# EAGLE design pocket_sdr_v2.1 (EAGLE 9.6.2)
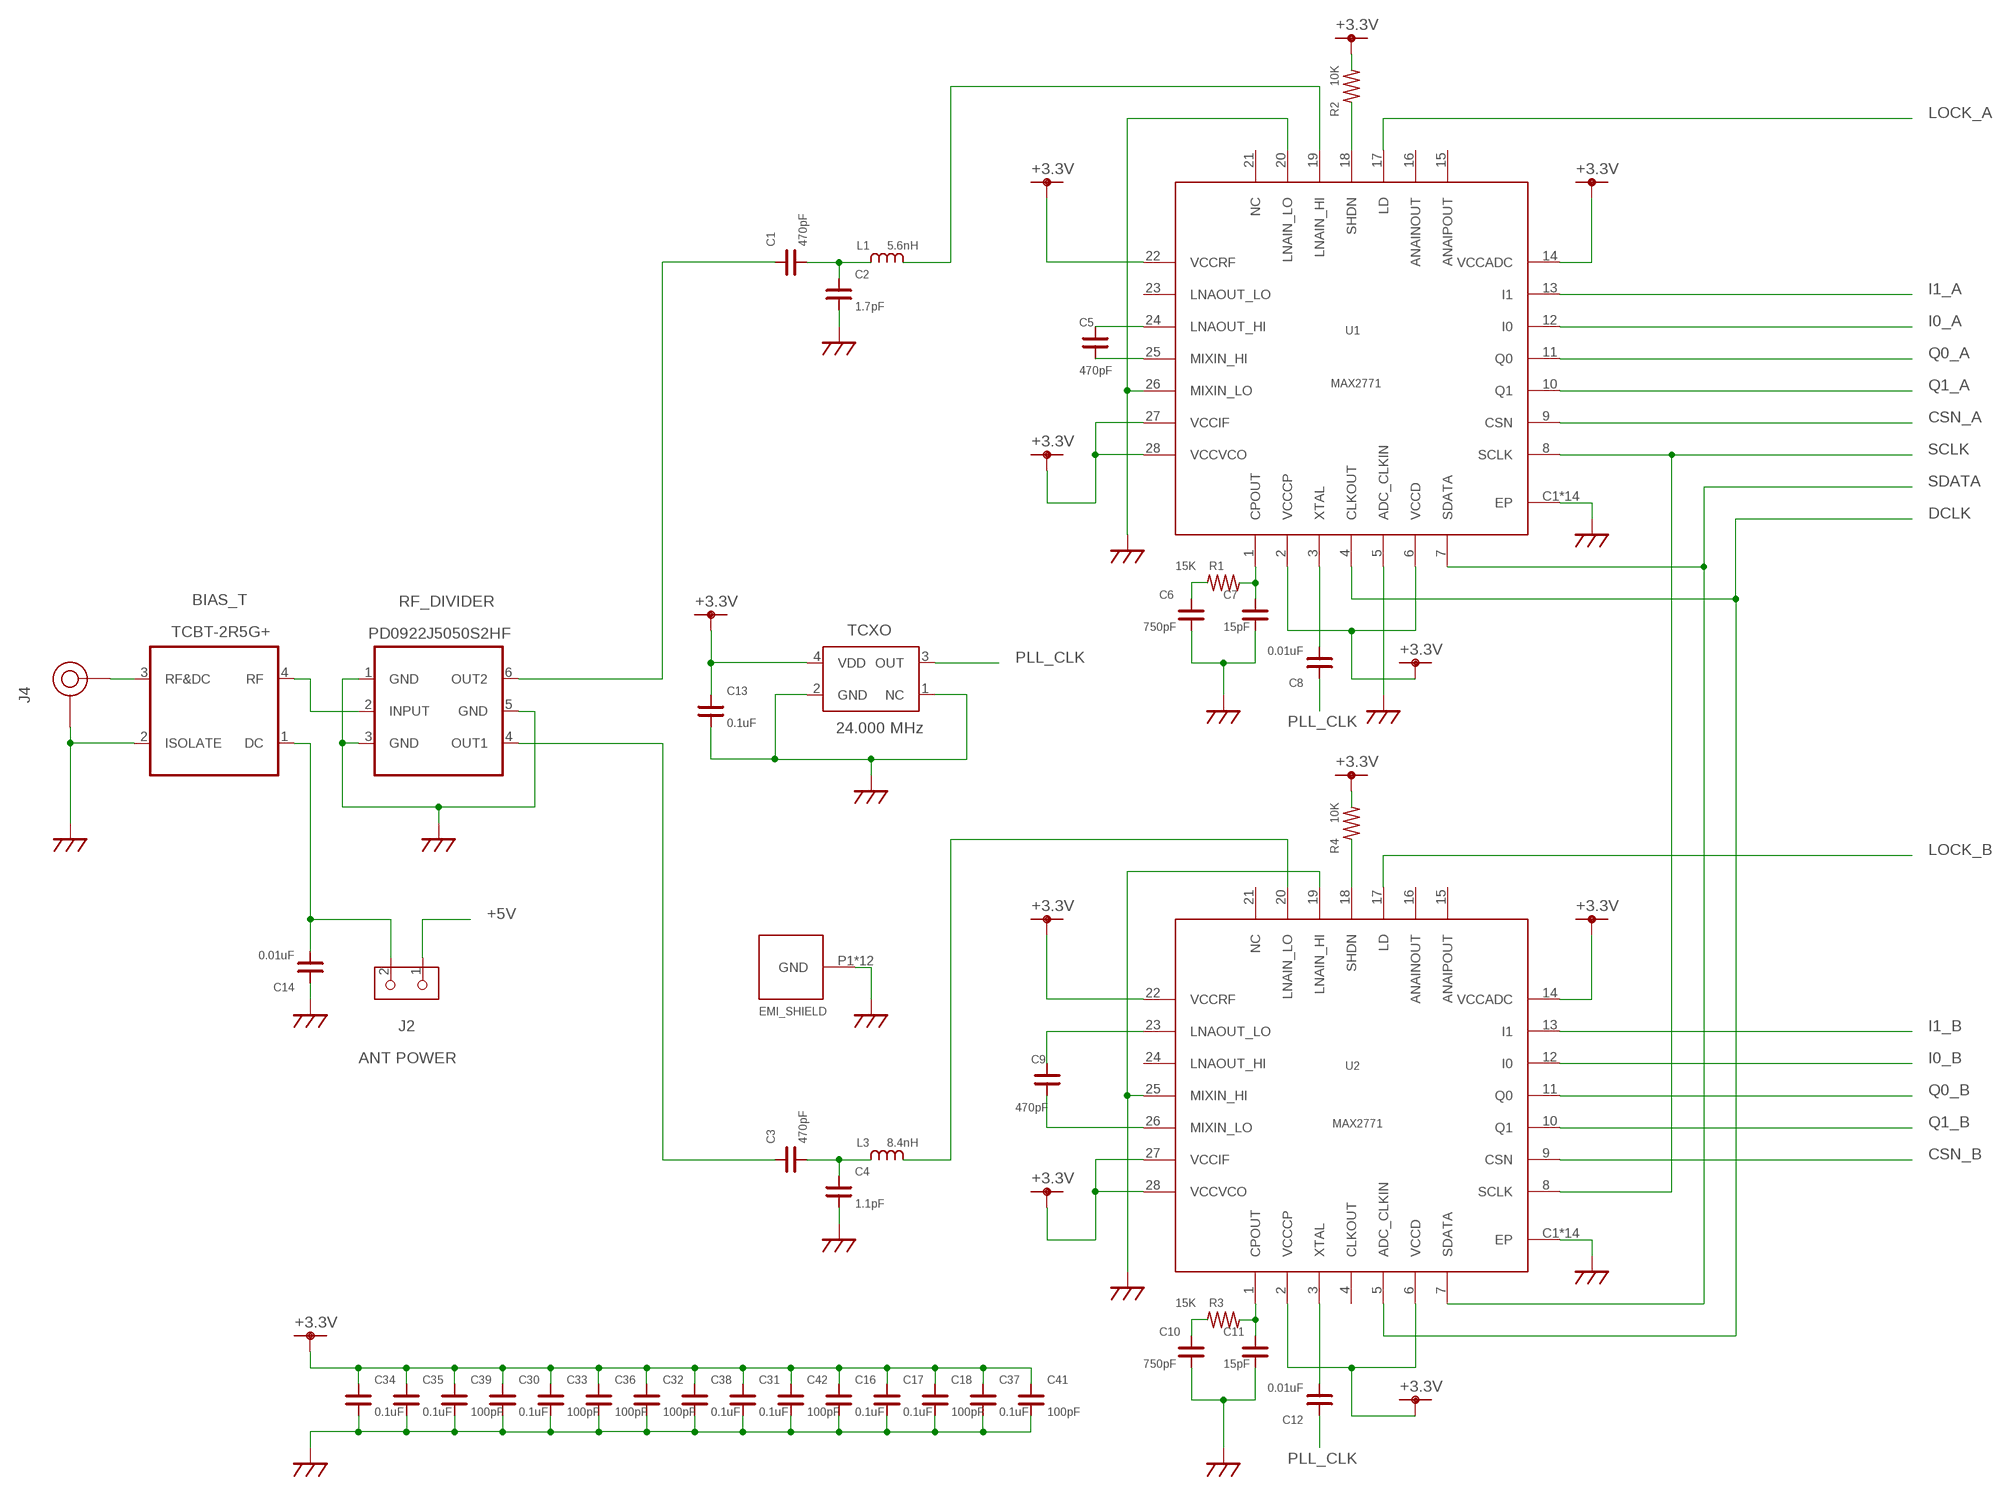
[diagram p0: schematic, sheet 1, part 1 of 2]
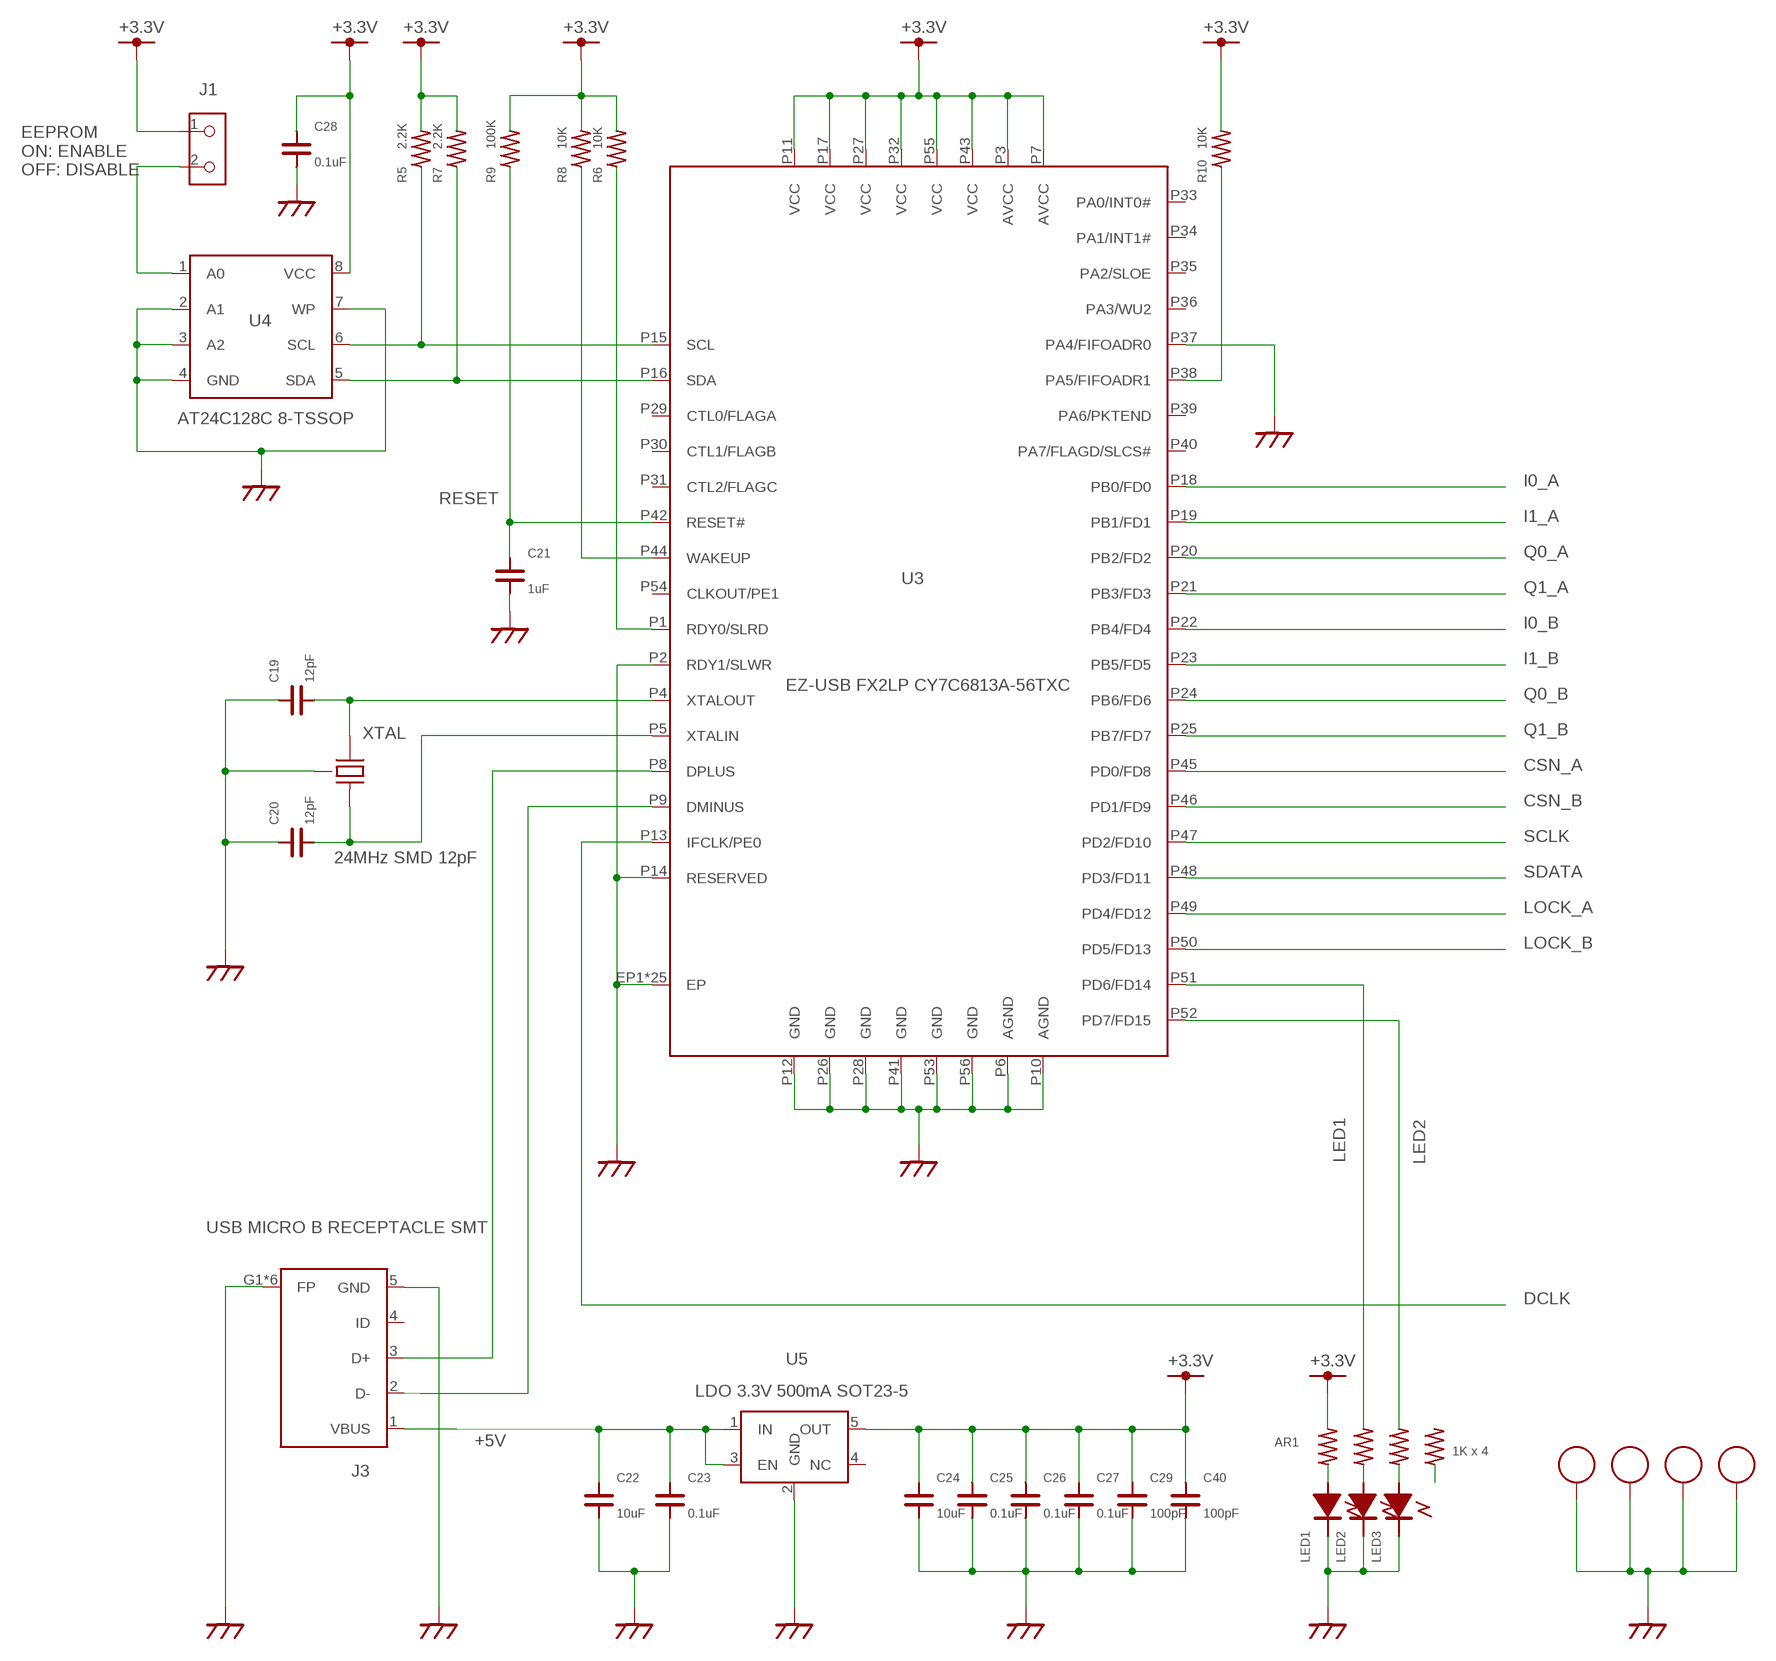
[diagram p1: schematic, sheet 1, part 2 of 2]

## Parts
AR1  1K x 4  ARRAY_REG__EXB28V  [EXB28V]
BIAS_T  TCBT-2R5G+  BIAS_T  [BIAS_T]
C1  470pF  C1005  [C1005]
C2  1.7pF  C1005  [C1005]
C3  470pF  C1005  [C1005]
C4  1.1pF  C1005  [C1005]
C5  470pF  C1005  [C1005]
C6  750pF  C1005  [C1005]
C7  15pF  C1005  [C1005]
C8  0.01uF  C1005  [C1005]
C9  470pF  C1005  [C1005]
C10  750pF  C1005  [C1005]
C11  15pF  C1005  [C1005]
C12  0.01uF  C1005  [C1005]
C13  0.1uF  C1005  [C1005]
C14  0.01uF  C1005  [C1005]
C16  0.1uF  C1005  [C1005]
C17  0.1uF  C1005  [C1005]
C18  100pF  C1005  [C1005]
C19  12pF  C1005  [C1005]
C20  12pF  C1005  [C1005]
C21  1uF  C1005  [C1005]
C22  10uF  C3225  [C3225]
C23  0.1uF  C1005  [C1005]
C24  10uF  C3225  [C3225]
C25  0.1uF  C1005  [C1005]
C26  0.1uF  C1005  [C1005]
C27  0.1uF  C1005  [C1005]
C28  0.1uF  C1005  [C1005]
C29  100pF  C1005  [C1005]
C30  0.1uF  C1005  [C1005]
C31  0.1uF  C1005  [C1005]
C32  100pF  C1005  [C1005]
C33  100pF  C1005  [C1005]
C34  0.1uF  C1005  [C1005]
C35  0.1uF  C1005  [C1005]
C36  100pF  C1005  [C1005]
C37  0.1uF  C1005  [C1005]
C38  0.1uF  C1005  [C1005]
C39  100pF  C1005  [C1005]
C40  100pF  C1005  [C1005]
C41  100pF  C1005  [C1005]
C42  100pF  C1005  [C1005]
J1  PIN HEADER 2MM 2P  PINH_2MM_2P  [PINH-2MM-2P]
J2  PIN HEADER 2MM 2P  PINH_2MM_2P  [PINH-2MM-2P]
J3  USB MICRO B RECEPTACLE SMT  MICROUSB  [MICROUSB]
J4  SMA JACK EDGE MNT  SMA-ANG  [SMA-ANG]
L1  5.6nH  L1608  [C1608]
L3  8.4nH  L1608  [C1608]
LED1  LED1608 GREEN  LED1608  [LED_1608]
LED2  LED1608 BLUE  LED1608  [LED_1608]
LED3  LED1608 BLUE  LED1608  [LED_1608]
R1  15K  R1005  [C1005]
R2  10K  R1005  [C1005]
R3  15K  R1005  [C1005]
R4  10K  R1005  [C1005]
R5  2.2K  R1005  [C1005]
R6  10K  R1005  [C1005]
R7  2.2K  R1005  [C1005]
R8  10K  R1005  [C1005]
R9  100K  R1005  [C1005]
R10  10K  R1005  [C1005]
RF-SHEILD-CASE  BMI-S-202-F BMI-S-202-C  BMI-S-202  [BMI-S-202]
RF_DIVIDER  PD0922J5050S2HF  RF_DIV  [RF_DIV]
TCXO  24.000 MHz  TCXO  [TCXO]
U1  MAX2771  [TQFN28]
U2  MAX2771  [TQFN28]
U3  EZ-USB FX2LP CY7C6813A-56TXC  CY7C6813A  [QFN56]
U4  AT24C128C 8-TSSOP  AT24C256C  [TSSOP_8P]
U5  LDO 3.3V 500mA SOT23-5  LDO_SOT  [SOT23]
U$53  CPAD_2.2MM  [CPAD_2.2MM]
U$54  CPAD_2.2MM  [CPAD_2.2MM]
U$55  CPAD_2.2MM  [CPAD_2.2MM]
U$58  CPAD_2.2MM  [CPAD_2.2MM]
XTAL  24MHz SMD 12pF  XTAL_SMD  [XTAL_SMD]

## Nets
+3.3V: AR1.2 C13.1 C16.1 C17.1 C18.1 C24.P$1 C25.1 C26.1 C27.1 C28.1 C29.1 C30.1 C31.1 C32.1 C33.1 C34.1 C35.1 C36.1 C37.1 C38.1 C39.1 C40.1 C41.1 C42.1 J1.1 R2.2 R4.2 R5.2 R6.2 R7.2 R8.2 R9.2 R10.2 TCXO.4(VDD) U1.2(VCCCP) U1.6(VCCD) U1.14(VCCADC) U1.22(VCCRF) U1.27(VCCIF) U1.28(VCCVCO) U2.2(VCCCP) U2.6(VCCD) U2.14(VCCADC) U2.22(VCCRF) U2.27(VCCIF) U2.28(VCCVCO) U3.P3(AVCC) U3.P7(AVCC) U3.P11(VCC) U3.P17(VCC) U3.P27(VCC) U3.P32(VCC) U3.P43(VCC) U3.P55(VCC) U4.8(VCC) U5.5(OUT)
+5V: C22.P$1 C23.1 J2.1 J3.1(VBUS) U5.1(IN) U5.3(EN)
CSN_A: U1.9(CSN) U3.P45(PD0/FD8)
CSN_B: U2.9(CSN) U3.P46(PD1/FD9)
DCLK: U1.4(CLKOUT) U2.5(ADC_CLKIN) U3.P13(IFCLK/PE0)
FIFOADR1: R10.1 U3.P38(PA5/FIFOADR1)
GND: BIAS_T.2(ISOLATE) C2.1 C4.2 C6.2 C7.2 C10.2 C11.2 C13.2 C14.1 C16.2 C17.2 C18.2 C19.1 C20.1 C21.2 C22.P$2 C23.2 C24.P$2 C25.2 C26.2 C27.2 C28.2 C29.2 C30.2 C31.2 C32.2 C33.2 C34.2 C35.2 C36.2 C37.2 C38.2 C39.2 C40.2 C41.2 C42.2 J3.5(GND) J3.G1(FP) J3.G2(FP) J3.G3(FP) J3.G4(FP) J3.G5(FP) J3.G6(FP) J4.P2(GND) J4.P3(GND) J4.P4(GND) J4.P5(GND) LED1.2 LED2.2 LED3.2 RF-SHEILD-CASE.P1(GND) RF-SHEILD-CASE.P2(GND) RF-SHEILD-CASE.P3(GND) RF-SHEILD-CASE.P4(GND) RF-SHEILD-CASE.P5(GND) RF-SHEILD-CASE.P6(GND) RF-SHEILD-CASE.P7(GND) RF-SHEILD-CASE.P8(GND) RF-SHEILD-CASE.P9(GND) RF-SHEILD-CASE.P10(GND) RF-SHEILD-CASE.P11(GND) RF-SHEILD-CASE.P12(GND) RF_DIVIDER.1(GND) RF_DIVIDER.3(GND) RF_DIVIDER.5(GND) TCXO.1(NC) TCXO.2(GND) U1.5(ADC_CLKIN) U1.20(LNAIN_LO) U1.26(MIXIN_LO) U1.C1(EP) U1.C2(EP) U1.C3(EP) U1.C4(EP) U1.EP U1.V1(EP) U1.V2(EP) U1.V3(EP) U1.V4(EP) U1.V5(EP) U1.V6(EP) U1.V7(EP) U1.V8(EP) U1.V9(EP) U2.19(LNAIN_HI) U2.25(MIXIN_HI) U2.C1(EP) U2.C2(EP) U2.C3(EP) U2.C4(EP) U2.EP U2.V1(EP) U2.V2(EP) U2.V3(EP) U2.V4(EP) U2.V5(EP) U2.V6(EP) U2.V7(EP) U2.V8(EP) U2.V9(EP) U3.EP1(EP) U3.EP2(EP) U3.EP3(EP) U3.EP4(EP) U3.EP5(EP) U3.P2(RDY1/SLWR) U3.P6(AGND) U3.P10(AGND) U3.P12(GND) U3.P14(RESERVED) U3.P26(GND) U3.P28(GND) U3.P37(PA4/FIFOADR0) U3.P41(GND) U3.P53(GND) U3.P56(GND) U3.P$1(EP) U3.P$2(EP) U3.P$3(EP) U3.P$4(EP) U3.P$5(EP) U3.P$6(EP) U3.P$7(EP) U3.P$8(EP) U3.P$9(EP) U3.P$10(EP) U3.P$11(EP) U3.P$12(EP) U3.P$13(EP) U3.P$14(EP) U3.P$15(EP) U3.P$16(EP) U3.P$17(EP) U3.P$18(EP) U3.P$19(EP) U3.P$20(EP) U4.2(A1) U4.3(A2) U4.4(GND) U4.7(WP) U5.2(GND) U$53.EP U$54.EP U$55.EP U$58.EP XTAL.P2(GND) XTAL.P4(GND)
I0_A: U1.12(I0) U3.P18(PB0/FD0)
I0_B: U2.12(I0) U3.P22(PB4/FD4)
I1_A: U1.13(I1) U3.P19(PB1/FD1)
I1_B: U2.13(I1) U3.P23(PB5/FD5)
LED1: AR1.4 U3.P51(PD6/FD14)
LED2: AR1.6 U3.P52(PD7/FD15)
LOCK_A: U1.17(LD) U3.P49(PD4/FD12)
LOCK_B: U2.17(LD) U3.P50(PD5/FD13)
N$1: C5.2 U1.25(MIXIN_HI)
N$2: C5.1 U1.24(LNAOUT_HI)
N$3: BIAS_T.3(RF&DC) J4.P1(RF)
N$4: BIAS_T.4(RF) RF_DIVIDER.2(INPUT)
N$5: BIAS_T.1(DC) C14.2 J2.2
N$6: R6.1 U3.P1(RDY0/SLRD)
N$8: AR1.3 LED2.1(+)
N$9: C1.2 C2.2 L1.1
N$10: C8.2 U1.3(XTAL)
N$11: AR1.7
N$12: L1.2 U1.19(LNAIN_HI)
N$13: AR1.1 LED1.1(+)
N$14: C1.1 RF_DIVIDER.6(OUT2)
N$15: C9.2 U2.26(MIXIN_LO)
N$16: C9.1 U2.23(LNAOUT_LO)
N$17: C19.2 U3.P4(XTALOUT) XTAL.P1(XTAL1)
N$18: R2.1 U1.18(SHDN)
N$20: J3.3(D+) U3.P8(DPLUS)
N$22: C20.2 U3.P5(XTALIN) XTAL.P3(XTAL2)
N$23: AR1.5 LED3.1(+)
N$24: C7.1 R1.2 U1.1(CPOUT)
N$25: C6.1 R1.1
N$27: C11.1 R3.2 U2.1(CPOUT)
N$28: R7.1 U3.P16(SDA) U4.5(SDA)
N$29: R5.1 U3.P15(SCL) U4.6(SCL)
N$30: R8.1 U3.P44(WAKEUP)
N$32: C10.1 R3.1
N$33: J3.2(D-) U3.P9(DMINUS)
N$34: J1.2 U4.1(A0)
N$35: C3.1 RF_DIVIDER.4(OUT1)
N$37: C3.2 C4.1 L3.1
N$38: L3.2 U2.20(LNAIN_LO)
N$42: R4.1 U2.18(SHDN)
N$43: C12.2 U2.3(XTAL)
PLL_CLK: C8.1 C12.1 TCXO.3(OUT)
Q0_A: U1.11(Q0) U3.P20(PB2/FD2)
Q0_B: U2.11(Q0) U3.P24(PB6/FD6)
Q1_A: U1.10(Q1) U3.P21(PB3/FD3)
Q1_B: U2.10(Q1) U3.P25(PB7/FD7)
RESET: C21.1 R9.1 U3.P42(RESET#)
SCLK: U1.8(SCLK) U2.8(SCLK) U3.P47(PD2/FD10)
SDATA: U1.7(SDATA) U2.7(SDATA) U3.P48(PD3/FD11)
Unconnected: AR1.8 J3.4(ID) U1.15(ANAIPOUT) U1.16(ANAINOUT) U1.21(NC) U1.23(LNAOUT_LO) U2.4(CLKOUT) U2.15(ANAIPOUT) U2.16(ANAINOUT) U2.21(NC) U2.24(LNAOUT_HI) U3.P29(CTL0/FLAGA) U3.P30(CTL1/FLAGB) U3.P31(CTL2/FLAGC) U3.P33(PA0/INT0#) U3.P34(PA1/INT1#) U3.P35(PA2/SLOE) U3.P36(PA3/WU2) U3.P39(PA6/PKTEND) U3.P40(PA7/FLAGD/SLCS#) U3.P54(CLKOUT/PE1) U5.4(NC)

## Notes on the sheet
- EEPROM
  ON: ENABLE
  OFF: DISABLE
- ANT POWER

## Library data of the parts
AR1 = ttaka_desc:ARRAY_REG__EXB28V
BIAS_T = ttaka_misc:BIAS_T
C1-C14 C16-C21 C23 C25-C42 = ttaka_desc:C1005
C22 C24 = ttaka_desc:C3225
J1 J2 = ttaka_conn:PINH_2MM_2P
J3 = ttaka_conn:MICROUSB
J4 = ttaka_conn:SMA-ANG
L1 L3 = ublox:L1608
LED1-LED3 = ttaka_desc:LED1608
R1-R10 = ttaka_desc:R1005
RF-SHEILD-CASE = ttaka_misc:BMI-S-202
RF_DIVIDER = ttaka_misc:RF_DIV
TCXO = ttaka_misc:TCXO
U1 U2 = ttaka_ic:MAX2771
U3 = ttaka_ic:CY7C6813A
U4 = ttaka_ic:AT24C256C
U5 = ttaka_misc:LDO_SOT
U$53-U$55 U$58 = ttaka_misc:CPAD_2.2MM
XTAL = ttaka_misc:XTAL_SMD

## Board
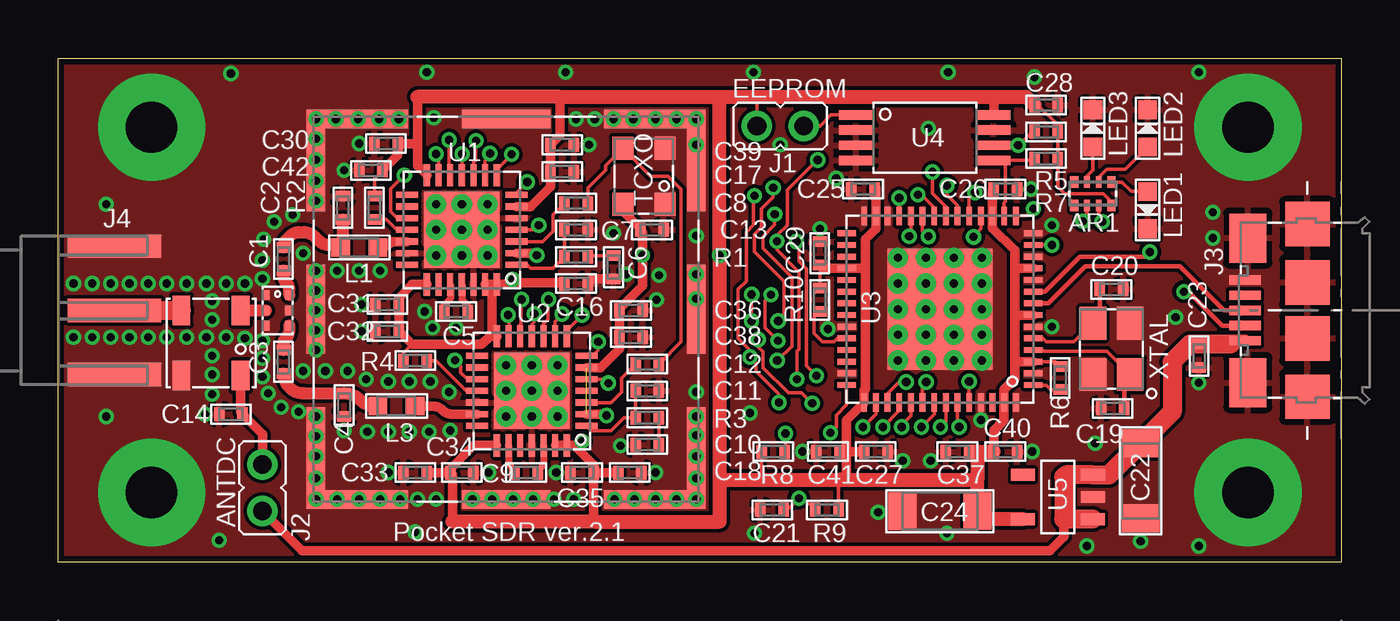
[diagram p2: board, top side]
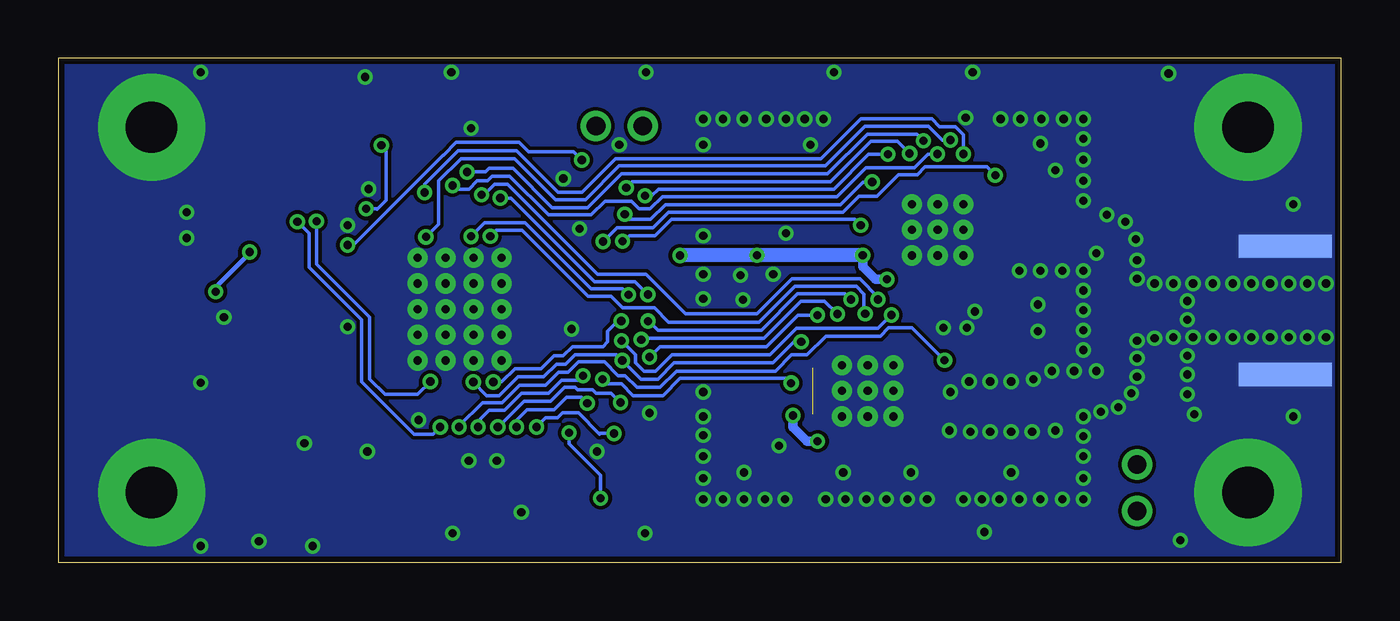
[diagram p3: board, bottom side, seen from below]

Size 55 x 21.6 mm. Coordinates in mm from the lower left corner, seen from the top.
Outline: 0,0 0,21.6 55,21.6 55,0 0,0
Copper layers (1*16): Top 0.035mm / dielectric 1.5mm / Bottom 0.035mm
Design rules "SeeedStudio_2layer_DRU_no_angle_20140221": minimum track width 6mil, minimum drill 12mil, track to track 6mil, track to pad 6mil, pad to pad 6mil, via to via 6mil, smd to smd 0mil, copper to edge 10mil, drill to drill 10mil, minimum pad ring 10mil, minimum via ring 6mil, stop-mask expansion 2mil, vias tented up to drill 100mil, thermal gap 10mil

### Footprints (pad centres in the part's own frame; a part is rotated, then mirrored left to right if it is on the bottom)
EXB28V = smd 0.35 x 0.5: 1 -0.8,-0.5; 2 -0.8,0.5; 7 0.8,-0.5; 8 0.8,0.5 | smd 0.25 x 0.5: 3 -0.25,-0.5; 4 -0.25,0.5; 5 0.25,-0.5; 6 0.25,0.5
BIAS_T = smd 0.762 x 1.27: 1 -1.27,1.397; 2 1.27,1.397; 3 1.27,-1.397; 4 -1.27,-1.397
C1005 = smd 0.45 x 0.6: 1 -0.5,0; 2 0.5,0
C3225 = smd 1.6 x 1.2: P$1 0,1.6; P$2 0,-1.6
PINH-2MM-2P = drill 0.8: 1 0,-1; 2 0,1
MICROUSB = smd 0.4 x 1.35: 1 -1.3,4.125; 2 -0.65,4.125; 3 0,4.125; 4 0.65,4.125; 5 1.3,4.125 | smd 1.9 x 1.9: G1 -3.7,1.45; G2 3.7,1.45; G5 -1.2,1.45; G6 1.2,1.45 | smd 2.1 x 1.6: G3 -3.1,4; G4 3.1,4
SMA-ANG = smd 1 x 4: P1 0,-4; P2 -2.75,-4; P3 2.75,-4 | smd 1 x 4 bottom: P4 -2.75,-4; P5 2.75,-4
C1608 = smd 0.8 x 0.8: 1 -0.8,0; 2 0.8,0
LED_1608 = smd 0.8 x 0.8: 1 -0.8,0; 2 0.8,0
BMI-S-202 = smd 4.35 x 0.8: P1 -6.375,-8.15; P3 6.375,-8.15; P7 6.375,8.15; P9 -6.375,8.15 | smd 3.8 x 0.8: P2 0,-8.15; P8 0,8.15 | smd 0.8 x 4.36: P4 8.15,-6.375; P6 8.15,6.375; P10 -8.15,6.375; P12 -8.15,-6.375 | smd 0.8 x 3.8: P5 8.15,0; P11 -8.15,0
RF_DIV = smd 0.41 x 0.33: 1 0.66,0.5; 2 0,0.5; 3 -0.66,0.5; 4 -0.66,-0.5; 5 0,-0.5; 6 0.66,-0.5
TCXO = smd 1 x 0.9: 1 -1.2,-0.9; 2 1.2,-0.9; 3 1.2,0.9; 4 -1.2,0.9
TQFN28 = smd 0.26 x 0.95: 1 -1.5,-2.34; 2 -1,-2.34; 3 -0.5,-2.34; 4 0,-2.34; 5 0.5,-2.34; 6 1,-2.34; 7 1.5,-2.34; 15 1.5,2.34; 16 1,2.34; 17 0.5,2.34; 18 0,2.34; 19 -0.5,2.34; 20 -1,2.34; 21 -1.5,2.34 | smd 0.95 x 0.26: 8 2.34,-1.5; 9 2.34,-1; 10 2.34,-0.5; 11 2.34,0; 12 2.34,0.5; 13 2.34,1; 14 2.34,1.5; 22 -2.34,1.5; 23 -2.34,1; 24 -2.34,0.5; 25 -2.34,0; 26 -2.34,-0.5; 27 -2.34,-1; 28 -2.34,-1.5 | smd 1.4 x 1.4: C1 -0.85,-0.85; C2 0.85,-0.85; C3 -0.85,0.85; C4 0.85,0.85 | smd 3.25 x 3.25: EP 0,0 | drill 0.35: V1 -1.1,-1.1; V2 0,-1.1; V3 1.1,-1.1; V4 -1.1,0; V5 0,0; V6 1.1,0; V7 -1.1,1.1; V8 0,1.1; V9 1.1,1.1
QFN56 = smd 5.2 x 4.5: EP1 0,0 | smd 2.4 x 2.05: EP2 -1.35,1.175; EP3 1.35,1.175; EP4 -1.35,-1.175; EP5 1.35,-1.175 | smd 0.25 x 0.8: P1 -3.25,-4; P2 -2.75,-4; P3 -2.25,-4; P4 -1.75,-4; P5 -1.25,-4; P6 -0.75,-4; P7 -0.25,-4; P8 0.25,-4; P9 0.75,-4; P10 1.25,-4; P11 1.75,-4; P12 2.25,-4; P13 2.75,-4; P14 3.25,-4; P29 3.25,4; P30 2.75,4; P31 2.25,4; P32 1.75,4; P33 1.25,4; P34 0.75,4; P35 0.25,4; P36 -0.25,4; P37 -0.75,4; P38 -1.25,4; P39 -1.75,4; P40 -2.25,4; P41 -2.75,4; P42 -3.25,4 | smd 0.8 x 0.25: P15 4,-3.25; P16 4,-2.75; P17 4,-2.25; P18 4,-1.75; P19 4,-1.25; P20 4,-0.75; P21 4,-0.25; P22 4,0.25; P23 4,0.75; P24 4,1.25; P25 4,1.75; P26 4,2.25; P27 4,2.75; P28 4,3.25; P43 -4,3.25; P44 -4,2.75; P45 -4,2.25; P46 -4,1.75; P47 -4,1.25; P48 -4,0.75; P49 -4,0.25; P50 -4,-0.25; P51 -4,-0.75; P52 -4,-1.25; P53 -4,-1.75; P54 -4,-2.25; P55 -4,-2.75; P56 -4,-3.25 | drill 0.35 pad 0.7: P$1 -1.1,1.8; P$2 1.1,1.8; P$3 0,1.8; P$4 -2.2,1.8; P$5 2.2,1.8; P$6 -2.2,0.6; P$7 -1.1,0.6; P$8 0,0.6; P$9 1.1,0.6; P$10 2.2,0.6; P$11 -2.2,-0.6; P$12 -1.1,-0.6; P$13 0,-0.6; P$14 1.1,-0.6; P$15 2.2,-0.6; P$16 -2.2,-1.8; P$17 -1.1,-1.8; P$18 0,-1.8; P$19 1.1,-1.8; P$20 2.2,-1.8
TSSOP_8P = smd 0.4 x 1.45: 1 -0.975,-2.95; 2 -0.325,-2.95; 3 0.325,-2.95; 4 0.975,-2.95; 5 0.975,2.95; 6 0.325,2.95; 7 -0.325,2.95; 8 -0.975,2.95
SOT23 = smd 0.508 x 1.016: 1 -0.95,-1.5; 2 0,-1.5; 3 0.95,-1.5; 4 0.95,1.5; 5 -0.95,1.5
CPAD_2.2MM = drill 2.2 pad 4.6: EP 0,0
XTAL_SMD = smd 1.4 x 1.15: P1 -1.1,-0.8; P2 1.1,-0.8; P3 1.1,0.8; P4 -1.1,0.8

### Placement (x,y rotation side)
AR1  44.35,15.8 180 top
BIAS_T  6.55,9.4 180 top
C1  9.65,13 90 top
C2  12.2,15.2 270 top
C3  9.65,8.6 270 top
C4  12.25,6.75 270 top
C5  17.05,10.75 0 top
C6  23.8,12.65 270 top
C7  22.2,14.25 0 top
C8  22.2,15.4 180 top
C9  20.05,3.85 0 top
C10  25.25,5.05 180 top
C11  25.25,7.35 0 top
C12  25.25,8.5 180 top
C13  25.45,14.25 0 top
C14  7.4,6.35 0 top
C16  22.2,11.95 0 top
C17  21.6,16.75 0 top
C18  24.5,3.85 0 top
C19  45.2,6.6 0 top
C20  45.15,11.7 180 top
C21  30.6,2.25 180 top
C22  46.4,3.5 0 top
C23  48.9,8.85 270 top
C24  37.8,2.2 270 top
C25  34.5,16 180 top
C26  40.6,16 0 top
C27  35.05,4.75 0 top
C28  42.35,19.6 0 top
C29  32.65,13.25 90 top
C30  14.05,17.95 180 top
C31  14.1,11.05 180 top
C32  14.1,9.9 180 top
C33  15.3,3.85 180 top
C34  17.3,3.85 0 top
C35  22.45,3.85 180 top
C36  24.55,10.8 0 top
C37  38.55,4.75 180 top
C38  24.55,9.65 0 top
C39  21.6,17.9 0 top
C40  40.6,4.75 0 top
C41  33,4.75 180 top
C42  13.4,16.8 180 top
J1  30.95,18.7 270 top
J2  8.75,3.2 0 top
J3  55,10.8 90 top
J4  -1.6,10.8 90 top
L1  12.9,13.5 0 top
L3  14.5,6.7 0 top
LED1  46.7,15.1 270 top
LED2  46.7,18.6 90 top
LED3  44.35,18.6 90 top
R1  22.2,13.1 180 top
R2  13.55,15.2 90 top
R3  25.25,6.2 180 top
R4  15.3,8.65 180 top
R5  42.35,18.45 0 top
R6  42.95,7.9 90 top
R7  42.35,17.3 0 top
R8  30.65,4.75 180 top
R9  32.95,2.25 0 top
R10  32.65,11.25 90 top
RF-SHEILD-CASE  19.2,10.85 0 top
RF_DIVIDER  9.4,10.8 90 top
TCXO  25.1,16.55 90 top
U1  17.3,14.25 90 top
U2  20.3,7.35 90 top
U3  37.8,10.85 90 top
U4  37.15,18.2 270 top
U5  42.85,2.8 90 top
U$53  4,18.65 0 top
U$54  4,3 0 top
U$55  51,18.65 0 top
U$58  51,3 0 top
XTAL  45.15,9.15 90 top

### Tracks (layer width: path | path; a pad name or v marks a point on that pad's centre or on a via)
+3.3V  (via drill 0.35)  (1 unrouted)
  Top 0.152: 14.55,17.8 C30.1 | J1.1 29.95,19.95 | C42.1 13.55,16.45 R2.2 | R4.2 14.8,8.98 15.16,9.34 | R7.2 R5.2 42.85,18.75 42,19.6 C28.1 | R7.2 42.95,17.2 | R8.2 30.15,3.55 | U3.P3 42.75,8.6 R6.2 | R7.2 42.85,16.1 43.15,15.8 44.8,15.8 45.15,15.45 AR1.2 | R9.2 33.45,3.45 33.55,3.55 | R10.2 32.65,12.45 32.8,12.6
  Top 0.305: U2.22 | U2.27 21.32,5.01
  Top 0.406: 34.6,12.6 34.6,13.85 35.05,14.3 U3.P27 35.05,16.06 C25.1 | 41,10.6 41,8.6 41.05,8.6 | U3.P11 41,12.6 | 41,12.6 41,13.37 40.05,14.32 U3.P17 40.05,15.95 C26.1 | U1.22 15.16,11.91 14.6,11.35 C31.1 C32.1 15.16,9.34 18.15,9.34 18.5,9.69 U2.14 18.6,9.69 18.6,11.61 U1.27 U1.28 19.26,11.91 v19.47,12.13 19.62,11.98 21.67,11.98 C16.1 | v23.5,6.29 23.44,6.35 U2.2 | U1.2 20.42,13.25 v20.51,13.16 | 34.6,12.6 U3.P32 32.8,12.6 C29.1 | 34.6,12.6 34.6,7.43 34.55,7.38 U3.P43 33.8,6.1 33.8,4.8 | U3.P7 41,10.6 | 41,12.6 41,10.6 | 41.05,8.6 U3.P3 | 41.05,8.6 41,8.55 41,7.85 40.55,7.4 U3.P55 40.55,6.1 40.1,5.65 C40.1 C37.1 | 21.5,19.95 21.5,18.3 C39.1 C17.1 21.1,16.1 20.25,15.25 U1.6 | TCXO.4 24.2,15.05 24.95,14.3 C13.1 25.05,14.15 v25.05,13.16 25.05,11.86 24.05,10.86 C36.1 C38.1 24.05,9.15 23.25,8.35 U2.6 | 15.4,19.95 15.4,17.95 | 15.4,17.95 15.4,16.99 U1.14 | 15.4,17.95 C30.1 | C35.1 22.95,4.19 22.2,4.94 v22.45,5.19 22.27,5.01 U2.28 21.32,5.01 | C34.1 16.9,3.75 16.9,1.74 | C34.1 C33.1 | C34.1 16.8,4 17.81,5.01 U2.22 | U4.8 40.1,19.9 40.15,19.95 | C42.1 14.55,17.45 14.55,17.8 | U4.8 40.12,19.2 | 33.55,3.55 33.8,3.8 33.8,4.75 | 33.8,4.8 33.8,4.75 | C41.1 33.55,4.8 33.8,4.8 | 33.8,4.75 C27.1 | U4.8 40.58,19.18 | C35.1 C18.1 | 22.98,1.76 23,1.74 | C35.1 22.95,1.74
  Top 0.61: 22.95,1.74 16.9,1.74 | 23,1.74 28.35,1.74 28.35,3.55 | 28.35,19.95 v28.35,13.15 28.35,3.55 | 15.4,19.95 21.5,19.95 28.35,19.95 | 28.35,19.95 29.95,19.95 40.15,19.95 41.5,19.95 C28.1 | U5.5 39.75,1.85 C24.P$1 39.4,3.55 | 28.35,3.55 30.15,3.55 33.55,3.55 39.4,3.55 | C40.1 39.4,4.75 39.4,3.55
  Bottom 0.406: v20.51,13.16 20.51,12.66 19.98,12.13 v19.47,12.13 | v22.45,5.19 22.9,5.19 23.5,5.79 v23.5,6.29
  Bottom 0.61: v20.51,13.16 v25.05,13.16 28.34,13.16 v28.35,13.15
+5V
  Top 0.406: J2.1 10.45,0.5 42.5,0.5 43.1,1.1 43.1,1.85
  Top 0.508: J3.1 50.4,9.5 50.25,9.35
  Top 0.813: 50.25,9.35 C23.1 48.51,9.35 47.75,8.59 47.75,6.45 C22.P$1 45.05,3.75 U5.3 43.2,3.75 43.1,3.65 43.1,1.85 U5.1
CSN_A  (via drill 0.35)
  Top 0.152: v36.35,7.73 36.05,7.73 35.55,7.23 U3.P45 | v18.5,17.52 18.5,17.42 18.3,17.22 U1.9 | v30.65,16.06 30.65,15.66 30.15,15.16 30.15,14.36 29.85,14.06 29.85,13.3 31.11,12.04 31.11,10.59 v30.86,10.34
  Bottom 0.152: v36.35,7.73 35.99,7.73 35.42,8.3 34.3,8.3 33.75,8.85 33.35,8.85 32.95,9.25 31.65,9.25 31.45,9.45 31.45,9.9 31.01,10.34 v30.86,10.34 | v18.5,17.52 19.03,18.04 20.16,18.04 21.89,16.31 30.4,16.31 v30.65,16.06
CSN_B  (via drill 0.35)
  Top 0.152: U3.P46 36.05,6.5 v35.35,5.8 | U2.9 21.3,10.29 21.31,10.29 21.31,10.31 21.6,10.6 v21.6,10.64 | v30.01,9.54 30.01,9.24 30.22,9.03 30.22,8.35 31.3,7.27 31.87,7.27 v32.32,6.82
  Bottom 0.152: v21.6,10.64 22.15,11.2 23.16,11.2 24.76,9.6 29.96,9.6 v30.01,9.54 | v35.35,5.8 35.35,6.1 34.9,6.55 33.74,6.55 33.22,7.07 32.57,7.07 v32.32,6.82
DCLK  (via drill 0.35)
  Top 0.152: v23.58,7.68 23.41,7.85 U2.5 | U1.4 20.4,14.25 v20.6,14.45 | v31.67,7.84 31.67,9.04 31.76,9.14 31.76,12.44 30.81,13.39 v30.81,13.76 30.81,14.01 31.25,14.45 31.25,14.67 31.27,14.69 31.27,15.97 v32.55,17.25 | U3.P13 42.35,13.6 v42.6,13.6
  Bottom 0.152: v30.81,13.76 30.76,13.76 30.51,14.01 29.41,14.01 28.71,14.7 20.85,14.7 v20.6,14.45 | v23.58,7.68 23.78,7.88 28.35,7.88 29.08,7.15 30.35,7.15 30.85,7.65 31.47,7.65 v31.67,7.84 | v32.55,17.25 32.9,17.6 34.85,17.6 35.25,18 37.94,18 38.49,17.45 38.5,17.45 42.35,13.6 v42.6,13.6
FIFOADR1
  Top 0.152: U3.P38 33.4,9.6 33.24,9.44 32.77,9.44 32.4,9.81 32.4,10.5 R10.1
GND  (via drill 0.35)
  Top 0.406: C16.2 22.9,12.15 C6.2
  other vias: 3.05,9.65 3.85,9.65 2.25,11.95 3.05,11.95 3.85,11.95 4.65,11.95 2.25,9.65 4.65,9.65 49.5,13.9 16.75,7.3 12.9,12.5 11.95,12.5 13.8,12.5 8.75,9.5 8.75,7.95 9,7.25 9.55,6.65 10.5,8.2 10.5,13.25 11.45,8.2 16.8,5.65 13.2,7.85 14.15,7.75 15.05,7.75 15.95,7.75 37.3,18.6 8.75,12.95 8.8,13.85 9.25,14.6 16.1,19.05 27.35,19 27.35,2.7 23.8,19 24.65,19 26.5,19 25.6,19 14.6,19 13.75,19 12.85,19 11.9,19 11.05,19 11.05,18.15 11.05,17.25 11.05,16.35 11.05,15.5 11.05,12.5 11.05,11.65 11.05,10.8 11.05,9.95 11.05,6.25 11.05,5.4 11.05,4.55 11.05,3.6 11.05,2.7 11.95,2.7 12.9,2.7 13.8,2.7 14.65,2.7 17.75,2.7 18.6,2.7 19.5,2.7 20.35,2.7 23.85,2.7 24.7,2.7 25.6,2.7 26.5,2.7 27.35,3.6 27.35,4.55 27.35,5.45 27.35,6.25 10.3,6.45 10.05,14.9 48.9,7.7 6.35,11.95 7.2,11.95 6.35,9.65 8,9.6 8,11.95 2.05,15.35 2.05,6.25 21.75,21 29.8,21 38.15,21 48.9,0.7 48.9,21 6.9,0.95 7.4,20.95 14.15,5.6 13.25,5.6 15.05,5.6 15.9,5.6 12.4,8.2 11.05,9.1 18.45,3.85 15.8,21 1.45,11.95 1.45,9.65 49.5,15 27.35,17.9 27.35,14 27.35,12.35 27.35,11.3 22.2,19 25.65,11.25 16.2,2.7 15.7,10.75 14.15,3.85 47.9,10.5 44.45,5.1 33,10 42.6,14.45 42.6,10.1 30.95,17.9 5.5,11.95 8.75,12.15 7.2,9.65 36.2,4.35 29.65,6.4 24.1,5 31.9,4.75 23.8,14.1 22.1,2.7 41.7,16 0.65,11.95 0.65,9.65 15.3,1.3 29.85,1.25 38.1,1.25 44.1,0.7 6.6,7.2 12.9,17.95 12.25,16.8 13,11.05 13,9.9 21.35,3.85 25.6,3.85 24.35,12.35 22.75,17.9 37.4,4.35 41.75,4.75 33.35,16.45 32.65,14.3 35.15,2.15 46.4,0.9 41.85,20.8 8.75,8.75 27.35,7.3 15.4,2.7 21.25,2.7 23,19 39.55,6.1 5.5,9.65 12.25,5.65 6.3,6.35 6.6,8.85 6.6,8.05 25.75,12.3 6.6,10.4 6.6,11.2 17.05,10.05 16.05,10.05
  pour Top: -14,31 -14,-12 65,-12 65,31
  pour Bottom: -15,32 -15,-13 66,-13 66,32
I0_A  (via drill 0.35)
  Top 0.152: v16.76,18.1 16.76,17.08 16.8,17.04 U1.12 | U3.P18 39.55,14.3 39.24,13.99 v39.24,13.95
  Bottom 0.152: v16.76,18.1 17.1,18.1 17.7,18.7 20.41,18.7 22.12,16.99 30.96,16.99 32.4,15.55 33.69,15.55 35.44,17.3 37.74,17.3 38.69,16.35 38.69,14.5 v39.24,13.95
I0_B  (via drill 0.35)
  Top 0.152: v36.86,15.76 37.01,15.76 37.55,15.21 U3.P22 | U2.12 19.8,10.18 19.84,10.22 19.84,11.25 v19.86,11.27
  Bottom 0.152: v36.86,15.76 36.74,15.76 36.3,16.2 35.73,16.2 31.88,12.35 29.8,12.35 28.1,10.65 25.05,10.65 23.55,12.15 20.64,12.15 19.86,11.37 v19.86,11.27
I1_A  (via drill 0.35)
  Top 0.152: v39.3,15.85 39.05,15.6 U3.P19 | v16.2,17.5 16.3,17.4 U1.13
  Bottom 0.152: v16.2,17.5 16.2,18.33 16.55,18.68 17.22,18.68 17.55,19 20.59,19 22.3,17.3 31.12,17.3 32.55,15.87 33.57,15.87 35.35,17.65 37.85,17.65 39.3,16.2 v39.3,15.85
I1_B  (via drill 0.35)
  Top 0.152: U2.13 19.33,9.72 19.33,10.55 v19.28,10.6 | v37.3,13.97 37.28,13.97 37.05,14.2 U3.P23 | v30.56,11.47 30.31,11.22 30.31,10.04 v30.85,9.5
  Bottom 0.152: v19.28,10.6 19.31,10.6 19.87,10.04 23.35,10.04 24.49,8.9 28.7,8.9 29.4,8.2 29.9,8.2 30.25,8.55 30.25,8.9 v30.85,9.5 | v37.3,13.97 36.72,14.55 35,14.55 32.17,11.72 30.81,11.72 v30.56,11.47
LED1  (via drill 0.35)
  Top 0.152: v38.62,5.8 38.55,5.88 U3.P51 | v44.75,14.6 44.6,14.75 AR1.4
  Bottom 0.152: v38.62,5.8 38.92,5.5 39.75,5.5 42,7.75 42,10.4 44.25,12.65 44.25,14.1 v44.75,14.6
LED2  (via drill 0.35)
  Top 0.152: v43.93,14.62 v43.92,14.62 44.1,14.8 AR1.6 | v39.05,7.75 U3.P52
  Bottom 0.152: v43.93,14.62 43.93,12.78 41.65,10.5 41.65,7.85 41,7.2 39.6,7.2 v39.05,7.75
LOCK_A  (via drill 0.35)
  Top 0.152: U1.17 14.92,14.79 14.49,14.79 14.26,15.03 14.26,16.02 v14.83,16.59 | v31.65,13.75 31.75,13.65 31.75,12.9 32.07,12.58 32.07,8.43 v32.5,8 | U3.P49 37.55,6.35 v37.01,5.8
  Bottom 0.152: v37.01,5.8 37.01,6.05 36.54,6.52 35.86,6.52 35.13,7.25 33.98,7.25 33.42,7.81 32.69,7.81 v32.5,8 | v31.65,13.75 31.05,14.35 29.5,14.35 28.84,15.01 21.36,15.01 20.68,15.7 19.9,15.7 18.99,16.61 18.17,16.61 17.84,16.94 15.18,16.94 v14.83,16.59
LOCK_B  (via drill 0.35)
  Top 0.152: U2.17 17.54,7.84 17.26,8.12 17.26,8.41 v17,8.66 | U3.P50 38.05,6.04 v37.81,5.8
  Bottom 0.152: v37.81,5.8 37.81,5.85 36.82,6.84 35.97,6.84 35.22,7.6 34.1,7.6 33.55,8.15 33.14,8.15 32.7,8.59 31.59,8.59 31,8 30.7,8 30.2,7.5 29.2,7.5 28.5,8.2 24.26,8.2 23.57,8.89 22.9,8.89 22.1,9.7 19.75,9.7 19.41,10.04 18.39,10.04 v17.01,8.66 v17,8.66
N$1
  Top 0.305: U1.25 17.3,11.26 17.55,11.01 C5.2
N$2
  Top 0.152: U1.24
  Top 0.305: U1.24 16.81,11.29 16.55,11.03 C5.1
N$3
  Top 0.813: J4.P1 BIAS_T.3
N$4
  Top 0.508: BIAS_T.4 RF_DIVIDER.2
N$5
  Top 0.406: BIAS_T.1 7.82,6.43 C14.2 8.75,5.5 J2.2
N$6
  Top 0.152: U3.P1 42.35,7.6 42.55,7.4 R6.1
N$8
  Top 0.152: LED2.1 45.75,16.85 44.95,16.85 44.6,16.5 AR1.3
N$9
  Top 0.508: C2.2 12.2,13.6 | 12.2,13.6 L1.1 | C1.2 arc-45 9.79,13.84 9.95,14 arc-45 10.31,14.15 10.5,14.15 arc-45 11.01,13.94 11.15,13.8 arc45 11.63,13.6 12.2,13.6
N$10
  Top 0.152: U1.3 20.75,13.75 21.2,14.2 21.2,14.9 C8.2
N$12
  Top 0.406: U1.19 14.37,13.75 arc45 14.25,13.7 arc-45 13.77,13.5 L1.2
N$13
  Top 0.152: AR1.1 45.6,16.3 46,15.9 LED1.1
N$14
  Top 0.508: RF_DIVIDER.6 9.9,11.71 arc45 9.8,11.95 arc-45 9.65,12.31 C1.1
N$15
  Top 0.305: U2.26 20.81,4.19 20.55,3.93 C9.2
N$16
  Top 0.305: U2.23 19.3,4.2 19.55,3.95 C9.1
N$17
  Top 0.152: XTAL.P1 44.95,9.05 42.25,9.05 42.2,9.1 U3.P4
  Top 0.203: XTAL.P1 45.7,7.8 C19.2
N$18
  Top 0.152: R2.1 14.05,14.7 14.5,14.25 U1.18
N$20
  Top 0.203: J3.3 49.97,10.8 48.09,12.68 44.03,12.68 42.45,11.1 U3.P8
N$22
  Top 0.152: U3.P5 42.2,9.6 42.35,9.45 43.55,9.45 XTAL.P3
  Top 0.203: C20.2 44.65,10.55 XTAL.P3
N$23
  Top 0.152: LED3.1 44.35,16.8 44.1,16.55 AR1.5
N$24
  Top 0.152: U1.1 20.09,12.75 20.24,12.6 21.2,12.6 R1.2 C7.1
N$25
  Top 0.152: R1.1 22.75,13.15 C6.1
N$27
  Top 0.152: U2.1 22.84,5.65 23.7,5.65 24.25,6.2 R3.2 C11.1
N$28
  Top 0.152: U3.P16 40.55,15.4 40.6,15.45 40.6,17.12 40.5,17.23 U4.5 41.77,17.23 R7.1
N$29  (via drill 0.35)
  Top 0.152: U4.6 v41.15,17.88 41.17,17.88 41.75,18.45 R5.1 | U3.P15 41.5,14.85 v41.8,15.15
  Bottom 0.152: v41.8,15.15 41.35,15.15 41.34,15.14 40.95,15.53 40.95,16.18 40.95,17.68 v41.15,17.88
N$30  (via drill 0.35)
  Top 0.152: U3.P44 35.05,6.35 v34.5,5.8 | v31.18,5.53 31.18,4.88 31.15,4.85 R8.1
  Bottom 0.152: v34.5,5.8 34.1,6.2 33.59,6.2 33.38,6.41 32.71,6.41 31.8,5.5 31.77,5.53 v31.18,5.53
N$32
  Top 0.152: R3.1 C10.1
N$33  (via drill 0.35)
  Top 0.203: U3.P9 42.3,11.6 43.8,13.1 46.6,13.1 v46.8,13.3 | v48.25,11.6 48.45,11.6 49.9,10.15 J3.2
  Bottom 0.203: v48.25,11.6 48.25,11.8 46.8,13.25 v46.8,13.3
N$34
  Top 0.152: U4.1 33.12,19.18 32.65,18.7 J1.2
N$35
  Top 0.508: RF_DIVIDER.4 9.9,9.96 arc-45 9.75,9.6 arc45 9.65,9.36 C3.1
N$37
  Top 0.508: C3.2 arc90 10.5,7.25 C4.1 arc-45 12.93,6.97 12.95,6.95 arc45 13.55,6.7 L3.1
N$38
  Top 0.406: L3.2 16.02,6.7 arc-45 16.5,6.5 arc45 16.86,6.35 U2.20
N$42
  Top 0.152: U2.18 17.49,7.35 16.19,8.65 R4.1
N$43
  Top 0.152: U2.3 23.7,6.85 24.15,7.3 24.15,7.9 C12.2
PLL_CLK
  Top 0.152: C12.1 26.7,9.45 26.7,16 26.15,16.55 25.4,16.55 TCXO.3 23.45,17 23.45,16.8 22.7,16.05 C8.1
Q0_A  (via drill 0.35)
  Top 0.152: U3.P20 38.55,15.3 38.1,15.75 v38.1,16.15 | U1.11 v17.3,17.5 v17.31,17.5
  Bottom 0.152: v38.1,16.15 37.95,16 37.4,16 37.05,16.35 36.6,16.35 36.4,16.55 35.65,16.55 33.99,14.89 32.15,14.89 31.57,15.47 30.42,15.47 30.09,15.14 29.62,15.14 29.1,15.67 21.61,15.67 20.37,16.91 18.3,16.91 17.71,17.5 v17.31,17.5
Q0_B  (via drill 0.35)
  Top 0.152: U2.11 20.3,10.2 20.41,10.31 v20.41,10.65 | U3.P24 36.55,14.05 v36.48,13.97
  Bottom 0.152: v20.41,10.65 20.46,10.7 20.46,11.5 20.78,11.82 23.43,11.82 24.95,10.3 28.84,10.3 29.45,10.91 30.81,10.91 31.3,11.4 32.3,11.4 35.12,14.22 36.23,14.22 v36.48,13.97
Q1_A  (via drill 0.35)
  Top 0.152: v37.48,16.73 37.48,15.82 38.05,15.25 U3.P21 | v17.91,18.07 v17.9,18.06 17.9,17.24 17.8,17.14 U1.10
  Bottom 0.152: v37.48,16.73 36.68,16.73 36.53,16.88 35.51,16.88 33.83,15.2 32.3,15.2 30.85,16.65 22.03,16.65 20.32,18.36 18.19,18.36 v17.91,18.07
Q1_B  (via drill 0.35)
  Top 0.152: U2.10 20.8,10.22 21,10.42 21,11.25 v21.02,11.27 | v36.05,15.61 36.05,15.56 U3.P25 | v29.72,10.34 v29.72,11.48
  Bottom 0.152: v21.02,11.27 21.27,11.52 23.3,11.52 24.86,9.96 29.29,9.96 29.67,10.34 v29.72,10.34 | v36.05,15.61 35.6,15.61 32.01,12.03 30.27,12.03 v29.72,11.48
RESET  (via drill 0.35)
  Top 0.152: U3.P42 33.8,6.75 33.35,6.3 33.35,5.8 v33.1,5.55 | C21.1 31.25,2.25 v31.75,2.75 31.95,2.75 R9.1
  Bottom 0.152: v33.1,5.55 33.1,5.09 31.75,3.74 v31.75,2.75
SCLK  (via drill 0.35)
  Top 0.152: U1.8 18.8,16.84 19.44,17.48 19.42,17.48 v19.43,17.49 | U2.8 21.8,9.95 v22.45,10.6 | v29.85,15.71 29.8,15.66 29.8,14.46 29.49,14.15 29.49,12.04 29.15,11.7 29.15,9.6 29.65,9.1 v29.65,8.8 29.91,8.54 29.91,8.19 30.9,7.2 v30.9,6.85 | U3.P47 36.55,6.29 36.16,5.9 v36.16,5.8
  Bottom 0.152: v19.43,17.49 20.26,17.49 21.75,16 29.27,16 29.56,15.71 v29.85,15.71 | v29.65,8.8 29.2,9.25 24.65,9.25 23.3,10.6 v22.45,10.6 | v36.16,5.8 36.14,5.8 35.04,6.9 33.9,6.9 33.3,7.5 32.84,7.5 32.74,7.4 32.1,7.4 31.95,7.25 31.3,7.25 v30.9,6.85
SDATA  (via drill 0.35)
  Top 0.152: v20.11,16.3 19.6,15.79 U1.7 | v30.71,14.92 30.71,14.47 30.2,13.96 30.2,13.47 31.45,12.22 31.45,9.27 v30.83,8.65 v30.82,8.65 | U2.7 22.9,8.85 23.15,9.1 v23.15,9.45 | U3.P48 37.05,7.57 v37.21,7.73
  Bottom 0.152: v37.21,7.73 36.63,7.15 36.1,7.15 35.3,7.95 34.2,7.95 33.65,8.5 33.25,8.5 32.85,8.9 31.07,8.9 v30.82,8.65 30.02,7.85 29.3,7.85 28.6,8.55 24.35,8.55 23.45,9.45 v23.15,9.45 | v20.11,16.3 20.51,16.3 21.48,15.33 28.97,15.33 29.6,14.7 30.49,14.7 v30.71,14.92

### Text on the board
tNames: EEPROM | U3 | ANTDC | Pocket SDR ver.2.1